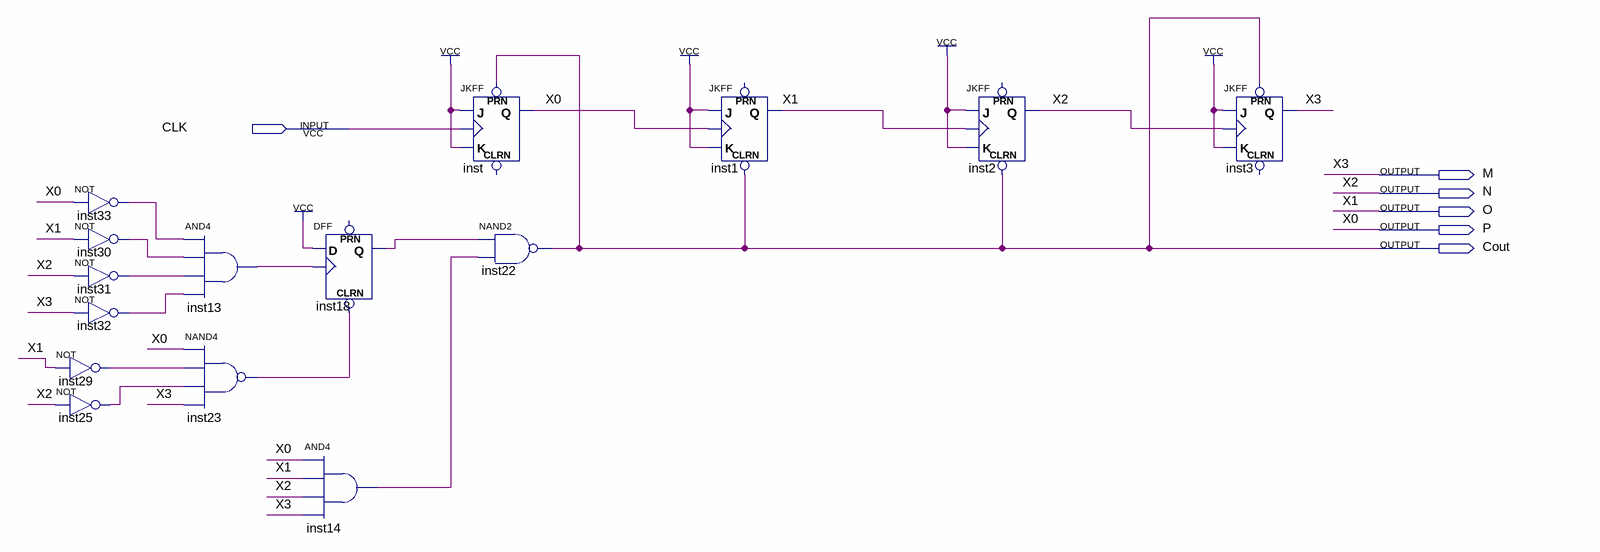
[diagram p0: schematic sheet]
// Quartus schematic Contador_Decre.bdf as structural Verilog: 15 symbols, 6 pins
module Contador_Decre (
  input  CLK,
  output M,
  output N,
  output O,
  output P,
  output Cout
);

  wire inst13_out, inst14_out, inst18_q, inst23_out, inst25_out, inst29_out, inst30_out, inst31_out,
       inst32_out, inst33_out;

  not inst33 (inst33_out, P);
  not inst30 (inst30_out, O);
  not inst31 (inst31_out, N);
  not inst32 (inst32_out, M);
  not inst29 (inst29_out, O);
  not inst25 (inst25_out, N);
  and inst13 (inst13_out, inst33_out, inst30_out, inst31_out, inst32_out);
  nand inst23 (inst23_out, P, inst29_out, inst25_out, M);
  DFF inst18 (.CLRN(inst23_out), .CLK(inst13_out), .D(1'b1), .Q(inst18_q));  // open: PRN
  and inst14 (inst14_out, P, O, N, M);
  JKFF inst (.PRN(Cout), .K(1'b1), .J(1'b1), .CLK(CLK), .Q(P));  // open: CLRN
  nand inst22 (Cout, inst18_q, inst14_out);
  JKFF inst1 (.CLRN(Cout), .K(1'b1), .J(1'b1), .CLK(P), .Q(O));  // open: PRN
  JKFF inst2 (.CLRN(Cout), .K(1'b1), .J(1'b1), .CLK(O), .Q(N));  // open: PRN
  JKFF inst3 (.PRN(Cout), .K(1'b1), .J(1'b1), .CLK(N), .Q(M));  // open: CLRN

  // Other names for the same wires on the sheet: X0 = P; X1 = O; X2 = N; X3 = M
endmodule
